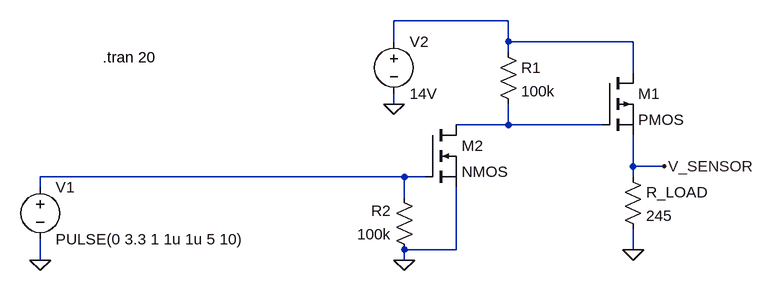
[diagram p0: schematic Power Switching Circuit.asc]
Power Switching Circuit.asc, the LTspice schematic file:
Version 4.1
SHEET 1 880 680
WIRE 224 80 48 80
WIRE 48 112 48 80
WIRE 224 112 224 80
WIRE 416 112 224 112
WIRE 224 128 224 112
WIRE 416 160 416 112
WIRE 48 208 48 192
WIRE 224 240 224 208
WIRE 224 240 144 240
WIRE 368 240 224 240
WIRE 416 304 416 256
WIRE 464 304 416 304
WIRE 64 320 -496 320
WIRE 96 320 64 320
WIRE 416 320 416 304
WIRE -496 336 -496 320
WIRE 64 352 64 320
WIRE 144 432 144 336
WIRE 144 432 64 432
WIRE 416 432 416 400
WIRE -496 448 -496 416
WIRE 64 448 64 432
FLAG 48 208 0
FLAG 64 448 0
FLAG 416 432 0
FLAG -496 448 0
FLAG 464 304 V_SENSOR
SYMBOL voltage 48 96 R0
WINDOW 123 0 0 Left 0
WINDOW 39 0 0 Left 0
SYMATTR InstName V2
SYMATTR Value 14V
SYMBOL pmos 368 160 R0
SYMATTR InstName M1
SYMBOL nmos 96 240 R0
SYMATTR InstName M2
SYMBOL res 208 112 R0
SYMATTR InstName R1
SYMATTR Value 100k
SYMBOL res 80 448 R180
WINDOW 0 36 76 Left 2
WINDOW 3 36 40 Left 2
SYMATTR InstName R2
SYMATTR Value 100k
SYMBOL res 400 304 R0
SYMATTR InstName R_LOAD
SYMATTR Value 245
SYMBOL voltage -496 320 R0
WINDOW 123 0 0 Left 0
WINDOW 39 0 0 Left 0
SYMATTR InstName V1
SYMATTR Value PULSE(0 3.3 1 1u 1u 5 10)
TEXT -400 136 Left 2 !.tran 20

The netlist it stands for:
* Power Switching Circuit.asc
V2 N001 0 14V
M1 N001 N002 V_SENSOR V_SENSOR PMOS
M2 N002 N003 0 0 NMOS
R1 N001 N002 100k
R2 0 N003 100k
R_LOAD V_SENSOR 0 245
V1 N003 0 PULSE(0 3.3 1 1u 1u 5 10)
.model NMOS NMOS
.model PMOS PMOS
.lib standard.mos
.tran 20
.backanno
.end